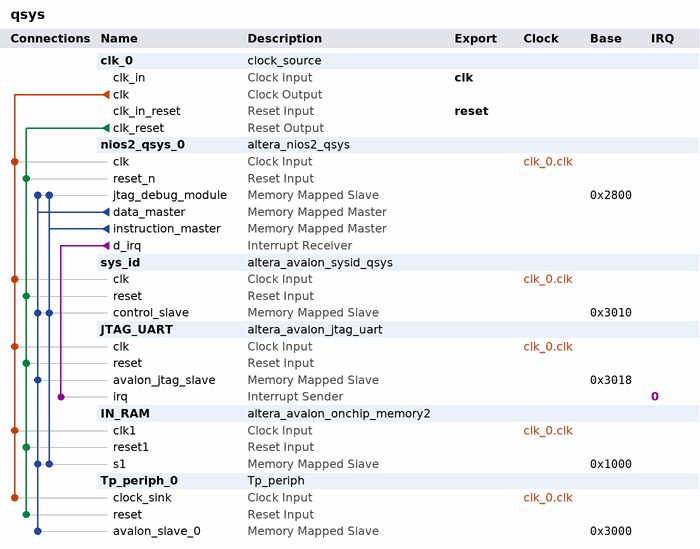
[diagram p0: system contents]
# Platform Designer (Qsys) system qsys, Cyclone II EP2C20F484C7
# Parameters at their usual value, and those the tool derives, are not listed.
package require -exact qsys 13.0
create_system qsys
set_project_property DEVICE_FAMILY {Cyclone II}
set_project_property DEVICE EP2C20F484C7

add_instance clk_0 clock_source 13.0
set_instance_parameter_value clk_0 clockFrequency 50000000

add_instance nios2_qsys_0 altera_nios2_qsys 13.0
set_instance_parameter_value nios2_qsys_0 resetSlave IN_RAM.s1
set_instance_parameter_value nios2_qsys_0 mmu_TLBMissExcSlave None
set_instance_parameter_value nios2_qsys_0 exceptionSlave IN_RAM.s1
set_instance_parameter_value nios2_qsys_0 breakSlave nios2_qsys_0.jtag_debug_module
set_instance_parameter_value nios2_qsys_0 impl Tiny
set_instance_parameter_value nios2_qsys_0 icache_size 4096

add_instance sys_id altera_avalon_sysid_qsys 13.0
set_instance_parameter_value sys_id id 0

add_instance JTAG_UART altera_avalon_jtag_uart 13.0.1.99.2
set_instance_parameter_value JTAG_UART simInteractiveOptions NO_INTERACTIVE_WINDOWS

add_instance IN_RAM altera_avalon_onchip_memory2 13.0.1.99.2
set_instance_parameter_value IN_RAM dataWidth 32
set_instance_parameter_value IN_RAM dualPort false
set_instance_parameter_value IN_RAM initMemContent true
set_instance_parameter_value IN_RAM initializationFileName onchip_mem.hex
set_instance_parameter_value IN_RAM memorySize 4096

add_instance Tp_periph_0 Tp_periph 1.0

# connections
add_connection clk_0.clk IN_RAM.clk1 clock
add_connection clk_0.clk JTAG_UART.clk clock
add_connection clk_0.clk nios2_qsys_0.clk clock
add_connection clk_0.clk sys_id.clk clock
add_connection clk_0.clk Tp_periph_0.clock_sink clock
add_connection clk_0.clk_reset IN_RAM.reset1 reset
add_connection clk_0.clk_reset JTAG_UART.reset reset
add_connection clk_0.clk_reset nios2_qsys_0.reset_n reset
add_connection clk_0.clk_reset sys_id.reset reset
add_connection clk_0.clk_reset Tp_periph_0.reset reset
add_connection nios2_qsys_0.data_master IN_RAM.s1 avalon
set_connection_parameter_value nios2_qsys_0.data_master/IN_RAM.s1 baseAddress 0x1000
add_connection nios2_qsys_0.data_master JTAG_UART.avalon_jtag_slave avalon
set_connection_parameter_value nios2_qsys_0.data_master/JTAG_UART.avalon_jtag_slave baseAddress 0x3018
add_connection nios2_qsys_0.data_master nios2_qsys_0.jtag_debug_module avalon
set_connection_parameter_value nios2_qsys_0.data_master/nios2_qsys_0.jtag_debug_module baseAddress 0x2800
add_connection nios2_qsys_0.data_master sys_id.control_slave avalon
set_connection_parameter_value nios2_qsys_0.data_master/sys_id.control_slave baseAddress 0x3010
add_connection nios2_qsys_0.data_master Tp_periph_0.avalon_slave_0 avalon
set_connection_parameter_value nios2_qsys_0.data_master/Tp_periph_0.avalon_slave_0 baseAddress 0x3000
add_connection nios2_qsys_0.instruction_master IN_RAM.s1 avalon
set_connection_parameter_value nios2_qsys_0.instruction_master/IN_RAM.s1 baseAddress 0x1000
add_connection nios2_qsys_0.instruction_master nios2_qsys_0.jtag_debug_module avalon
set_connection_parameter_value nios2_qsys_0.instruction_master/nios2_qsys_0.jtag_debug_module baseAddress 0x2800
add_connection nios2_qsys_0.instruction_master sys_id.control_slave avalon
set_connection_parameter_value nios2_qsys_0.instruction_master/sys_id.control_slave baseAddress 0x3010
add_connection nios2_qsys_0.d_irq JTAG_UART.irq interrupt
set_connection_parameter_value nios2_qsys_0.d_irq/JTAG_UART.irq irqNumber 0

# exported interfaces
add_interface clk clock sink
set_interface_property clk EXPORT_OF clk_0.clk_in
add_interface reset reset sink
set_interface_property reset EXPORT_OF clk_0.clk_in_reset

set_interconnect_requirement {$system} qsys_mm.clockCrossingAdapter HANDSHAKE
set_interconnect_requirement {$system} qsys_mm.maxAdditionalLatency 1

save_system qsys.qsys
